# Altium schematic sheet 04_VIBRATION_FAULT.SchDoc
size A4; SheetNumber: 4; SheetTotal: 6
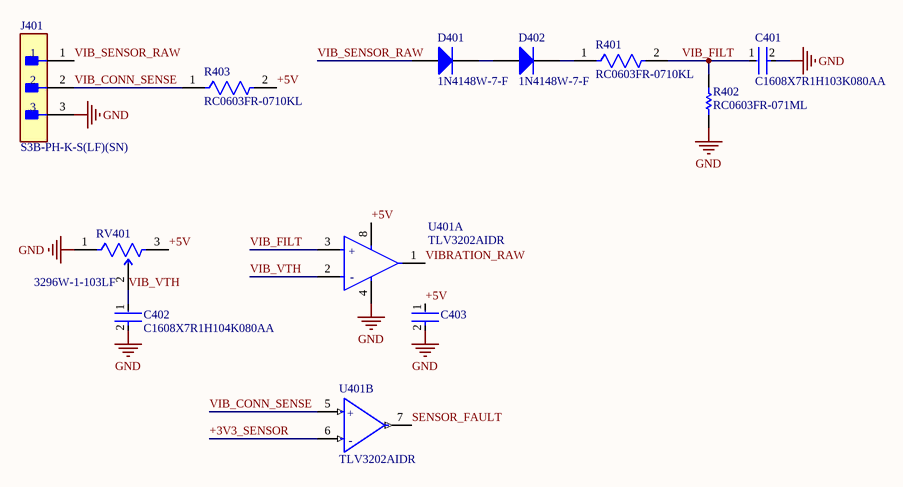
[diagram p0: 04_VIBRATION_FAULT.SchDoc]

## Parts
C401  C1608X7R1H103K080AA  [FP-C1608-080-0_1-MFG]
C402  C1608X7R1H104K080AA  [FP-C1608-080-0_1-IPC_B]
C403  C1608X7R1H104K080AA  [FP-C1608-080-0_1-IPC_B]  (value not drawn)
D401  1N4148W-7-F  [DIOD-SOD123-2_V]
D402  1N4148W-7-F  [DIOD-SOD123-2_V]
J401  S3B-PH-K-S(LF)(SN)  [FP-S3B-PH-K-S_LF_SN-MFG]
R401  RC0603FR-0710KL  [FP-RC0603-0_55-IPC_C]
R402  RC0603FR-071ML  [RESC1608X55X25LL10T15]
R403  RC0603FR-0710KL  [FP-RC0603-0_55-IPC_C]
RV401  3296W-1-103LF  [FP-3296W-MFG]
U401  TLV3202AIDR  [FP-D0008A-IPC_B]  (parts A,B of 2)

## Nets
GND: C401.2 C402.2 C403.2 J401.3 R402.2 RV401.1(CCW) U401.4(GND)
+3V3_SENSOR: U401.6(2IN-)
+5V: C403.1 R403.2 RV401.3(CW) U401.8(VCC)
SENSOR_FAULT: U401.7(2OUT)
VIB_CONN_SENSE: J401.2 R403.1 U401.5(2IN+)
VIB_FILT: C401.1 R401.2 R402.1 U401.3(1IN+)
VIB_SENSOR_RAW: D401.1(A) J401.1
VIB_VTH: C402.1 RV401.2(WIPER) U401.2(1IN-)
VIBRATION_RAW: U401.1(1OUT)
NetD401_2: D401.2(K) D402.1(A)
NetD402_2: D402.2(K) R401.1

## Notes on the sheet
- (in symbol CMP-04896-000095-1, part A) +; -
- (in symbol CMP-04896-000095-1, part B) +; -

## Library data of the parts
C401 = CMP-2000-06026-2: Multilayer Ceramic Capacitors 10nF ±10% 50V X7R SMD 0603; Voltage: 50V; Depth: 0.8mm; REACH SVHC: No SVHC; Packaging: Tape and Reel; Dielectric Material: Ceramic; Dielectric: X7R; Min Operating Temperature: -55°C; Package Quantity: 1; Width: 0.031inch; Case Code (Imperial): 0603; Radiation Hardening: No; Length: 1.6mm; RoHS Compliant: Yes; Tolerance: 10%; Termination: SMD/SMT; Mount: Surface Mount; Construction: Flat; Resistor Type: Ceramic; Max Operating Temperature: 125°C; Series: C; Lead Free: Lead Free; Capacitance: 10nF; Voltage Rating (DC): 50V; Thickness: 0.037inch; Voltage Rating: 50V; Height: 0.8mm; Weight: 7.1E-05oz; Case/Package: 0603; Case Code (Metric): 1608
C402 C403 = CMP-2000-04982-2: Multilayer Ceramic Capacitors 100nF ±10% 50V X7R SMD 0603; REACH SVHC: No SVHC; Voltage: 50V; Min Operating Temperature: -55°C; Package Quantity: 1; Case Code (Metric): 1608; Series: C; Termination: SMD/SMT; Length: 1.6mm; Voltage Rating: 50V; Case Code (Imperial): 0603; Number of Pins: 2; RoHS Compliant: Yes; Thickness: 0.037inch; Resistor Type: Ceramic; Radiation Hardening: No; Weight: 7.1E-05oz; Mount: Surface Mount; Capacitance: 100nF; Voltage Rating (DC): 50V; Construction: Flat; Tolerance: 10%; Lead Free: Lead Free; Case/Package: 0603; Max Operating Temperature: 125°C; Height: 0.8mm; Depth: 0.8mm; Packaging: Tape and Reel; Width: 0.031inch; Dielectric Material: Ceramic; Dielectric: X7R
D401 D402 = CMP-2000-04932-2: Fast Switching Diode, 100 V, 0.15 A, -65 to 150 degC, 2-Pin?SOD123, RoHS, Tape and Reel; Recovery Time: 4ns; Brand: DiodesIncorporated; Unit Weight: 0.000353oz; Max Surge Current: 2A; Peak Reverse Voltage: 100V; Ir - Reverse Current: 1uA; Vf - Forward Voltage: 1.25V; Configuration: Single; If - Forward Current: 0.15A; Product Category: Diodes-GeneralPurpose,Power,Switching; Operating Temperature Range: -65Cto+150C; Packaging: Reel; Manufacturer URL: http://www.diodes.com/; Maximum Operating Temperature: +150C; Height: 1.25mm; Minimum Operating Temperature: -65C; Product: SwitchingDiodes; Package URL: http://www.diodes.com/datasheets/ds18004.pdf; Type: SwitchingDiode; Package Reference: SOD123-2; Width: 1.7mm; Datasheet URL: http://www.farnell.com/datasheets/1915529.pdf; Datasheet Version: Rev. 24-2, 10/2013; Series: 1N4148; Factory Pack Quantity: 3000; Length: 2.85mm; RoHS: True; Manufacturer: DiodesIncorporated; Mounting Style: SMD/SMT; Package / Case: SOD-123
J401 = CMP-17439-000039-1: CONN HEADER R/A 3POS 2MM; Height: 0.31inch; Weight: 0.0625lb; Length: 0.31inch; Width: 0.31inch
R401 R403 = CMP-2100-03664-2: RES 10K OHM 1% 1/10W 0603; Voltage Rating: 75V; Voltage Rating (DC): 50V; Resistance: 10kR; Power Rating: 100mW; Temperature Coefficient: 100ppm/°C; Depth: 0.8mm; Termination: SMD/SMT; Resistor Type: Thick Film; Series: RC; Construction: Rectangular; Features: Moisture Resistant; Packaging: Tape and Reel; Min Operating Temperature: -55°C; Number of Terminations: 2; Lead Pitch: 0.3mm; RoHS Compliant: Yes; Case/Package: 0603; Resistance Tolerance: 1%; Military Standard: Not; Weight: 7.1E-05oz; Number of Pins: 2; Tolerance: 1%; Length: 1.6mm; Case Code (Imperial): 0603; Lead Free: Lead Free; Width: 0.8mm; Max Power Dissipation: 100mW; Height: 0.45mm; Max Operating Temperature: 155°C; Case Code (Metric): 1608; Size Code: 0603
R402 = CMP-1659-00056-1: Chip Resistor, 1 MOhm, +/- 1%, 100 mW, -55 to 155 degC, 0603 (1608 Metric), RoHS, Tape and Reel; Voltage Rating (DC): 25 V; Tolerance: 20%; Case\Package: Radial; Capacitance: 1 mF; Min Operating Temperature: -40 degC; PackageDescription: 2-Pin Surface Mount Device, Body 1.6 x 0.8 mm; ComponentLink1Description: Manufacturer URL; Radiation Hardening: No; DatasheetVersion: Rev. 4, 02/2016; REACH SVHC: No SVHC; Length: 20 mm; Max Operating Temperature: 85 degC; Diameter: 10 mm; Packaging: Bulk; Package Quantity: 200; PackageReference: 0603; Mount: Through Hole; ComponentLink1URL: http://www.yageo.com/; ComponentLink2URL: http://www.yageo.com/documents/recent/PYu-RC_Group_51_RoHS_L_04.pdf; ComponentLink2Description: Datasheet; Width: 0 inch; Lead Pitch: 5 mm; RoHSCompliant: true; Voltage Rating: 25 V; Height: 20 mm
RV401 = CMP-1747-00001-8: TRIMMER 10K OHM 0.5W PC PIN TOP; Number of Turns: 25; Tolerance: 10%; Resistance: 10kR; Max Power Dissipation: 500mW; Temperature Coefficient: 100ppm/°C; Insulation Resistance: 1GR; Min Operating Temperature: -55°C; Resistor Type: Cermet; Series: 3296; Color: Blue; Mount: Through Hole; Taper: Linear; Radiation Hardening: No; RoHS Compliant: Yes; Width: 9.53mm; Resistance Tolerance: 10%; Contact Plating: Tin; Military Standard: Not; Package Quantity: 50; Weight: 0.03oz; Lead Free: Lead Free; Power Rating: 500mW; Termination: Pin; Technology: CERMET; Max Operating Temperature: 125°C; Packaging: Rail/Tube; Length: 9.53mm; Depth: 4.83mm; Height: 11.55mm; Reach SVHC Compliant: Yes
U401 = CMP-04896-000095-1: IC COMPARATOR RRI DUAL 8SOIC; Power Supply Rejection Ratio (PSRR): 85dB; Output Type: PUSH-PULL; Number of Channels: 2; Propagation Delay: 50ns; Input Bias Current: 50pA; Hysteresis: 1.2mV; Common Mode Rejection Ratio: 70dB; Max Supply Current: 40uA; Response Time: 0.047us; Max Supply Voltage: 5.5V; Quiescent Current: 50uA; Min Supply Voltage: 2.7V; Input Offset Voltage (Vos): 5mV; Number of Pins: 8; Series: TLV3202; Type: General Purpose; Max Operating Temperature: 125°C; Packaging: Tape and Reel; Mount: Surface Mount; Max Input Current: 50pA; RoHS Compliant: Yes; Package Quantity: 2500; Case/Package: SOIC; Radiation Hardening: No; Contact Plating: Gold; Min Operating Temperature: -40°C; Number of Elements: 2; Lead Free: Lead Free; Supply Current: 50uA; Nominal Supply Current: 50uA